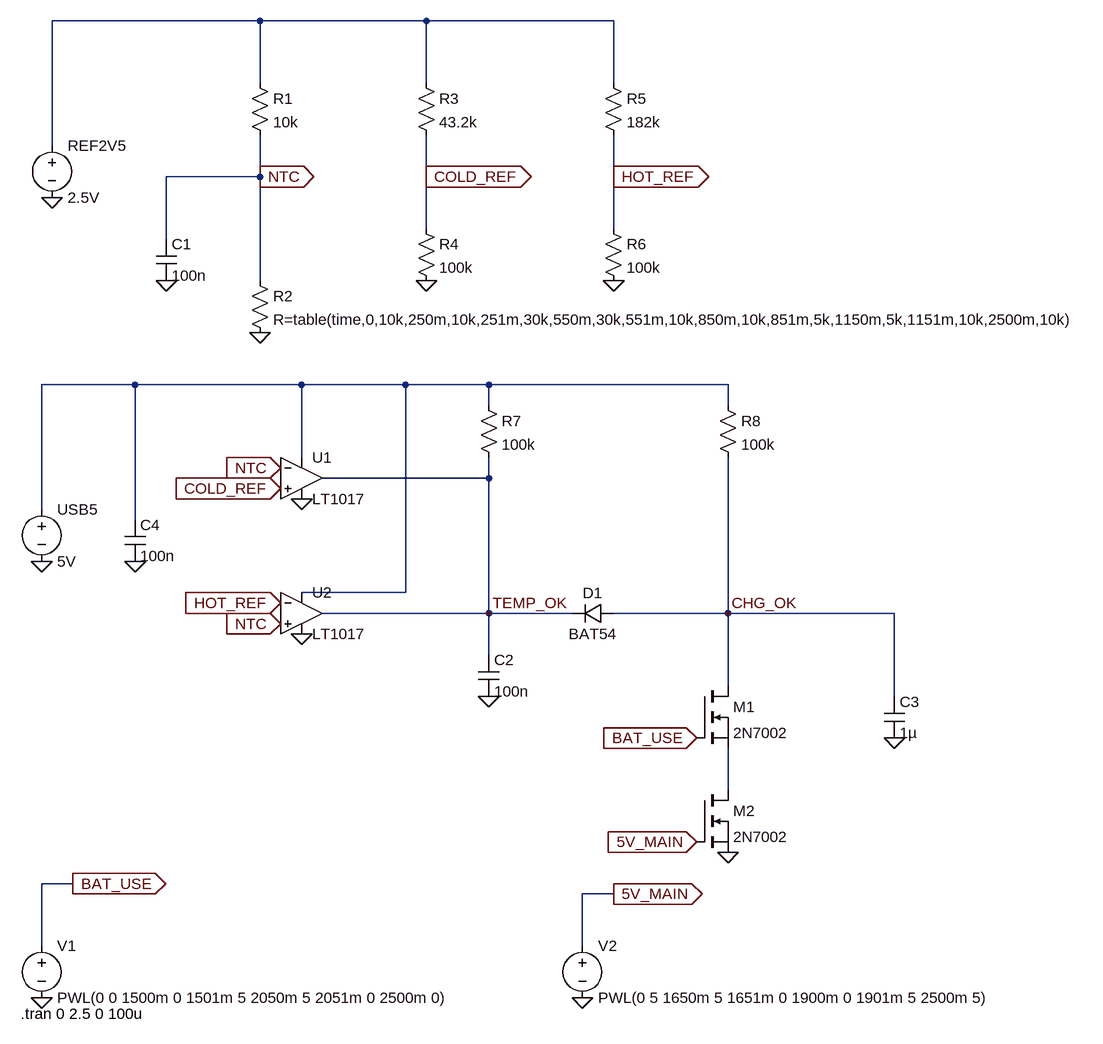
[diagram p0: schematic Temperature Protection.asc]
Temperature Protection.asc, the LTspice schematic file:
Version 4.1
SHEET 1 1864 1144
WIRE 192 -400 -128 -400
WIRE 448 -400 192 -400
WIRE 736 -400 448 -400
WIRE 192 -304 192 -400
WIRE 448 -304 448 -400
WIRE 736 -304 736 -400
WIRE -128 -208 -128 -400
WIRE 192 -160 192 -224
WIRE 192 -160 48 -160
WIRE 448 -160 448 -224
WIRE 736 -160 736 -224
WIRE 448 -80 448 -160
WIRE 736 -80 736 -160
WIRE 48 -64 48 -160
WIRE 192 0 192 -160
WIRE 0 160 -144 160
WIRE 256 160 0 160
WIRE 416 160 256 160
WIRE 544 160 416 160
WIRE 912 160 544 160
WIRE 544 192 544 160
WIRE 912 192 912 160
WIRE 256 272 256 160
WIRE 544 304 544 272
WIRE 544 304 288 304
WIRE -144 352 -144 160
WIRE 0 368 0 160
WIRE 416 480 416 160
WIRE 416 480 256 480
WIRE 544 512 544 304
WIRE 544 512 288 512
WIRE 672 512 544 512
WIRE 912 512 912 272
WIRE 912 512 736 512
WIRE 1168 512 912 512
WIRE 544 576 544 512
WIRE 912 624 912 512
WIRE 1168 640 1168 512
WIRE 912 784 912 720
WIRE -96 928 -144 928
WIRE 736 944 688 944
WIRE -144 1024 -144 928
WIRE 688 1024 688 944
FLAG 192 80 0
FLAG 48 0 0
FLAG -128 -128 0
FLAG 448 0 0
FLAG 736 0 0
FLAG 448 -160 COLD_REF
IOPIN 448 -160 Out
FLAG 736 -160 HOT_REF
IOPIN 736 -160 Out
FLAG 192 -160 NTC
IOPIN 192 -160 Out
FLAG 224 320 COLD_REF
IOPIN 224 320 In
FLAG 224 288 NTC
IOPIN 224 288 In
FLAG 224 528 NTC
IOPIN 224 528 In
FLAG 224 496 HOT_REF
IOPIN 224 496 In
FLAG 256 336 0
FLAG 256 544 0
FLAG -144 432 0
FLAG 544 640 0
FLAG 912 880 0
FLAG 1168 704 0
FLAG 864 704 BAT_USE
IOPIN 864 704 In
FLAG 864 864 5V_MAIN
IOPIN 864 864 In
FLAG -96 928 BAT_USE
IOPIN -96 928 Out
FLAG 736 944 5V_MAIN
IOPIN 736 944 Out
FLAG -144 1104 0
FLAG 688 1104 0
FLAG 0 432 0
FLAG 544 512 TEMP_OK
FLAG 912 512 CHG_OK
SYMBOL res 176 -320 R0
SYMATTR InstName R1
SYMATTR Value 10k
SYMBOL res 176 -16 R0
SYMATTR InstName R2
SYMATTR Value R=table(time,0,10k,250m,10k,251m,30k,550m,30k,551m,10k,850m,10k,851m,5k,1150m,5k,1151m,10k,2500m,10k)
SYMBOL cap 32 -64 R0
SYMATTR InstName C1
SYMATTR Value 100n
SYMBOL voltage -128 -224 R0
WINDOW 123 0 0 Left 0
WINDOW 39 0 0 Left 0
SYMATTR InstName REF2V5
SYMATTR Value 2.5V
SYMBOL res 432 -320 R0
SYMATTR InstName R3
SYMATTR Value 43.2k
SYMBOL res 432 -96 R0
SYMATTR InstName R4
SYMATTR Value 100k
SYMBOL res 720 -320 R0
SYMATTR InstName R5
SYMATTR Value 182k
SYMBOL res 720 -96 R0
SYMATTR InstName R6
SYMATTR Value 100k
SYMBOL voltage -144 336 R0
WINDOW 123 0 0 Left 0
WINDOW 39 0 0 Left 0
SYMATTR InstName USB5
SYMATTR Value 5V
SYMBOL Comparators\\LT1017 256 304 R0
SYMATTR InstName U1
SYMBOL Comparators\\LT1017 256 512 R0
SYMATTR InstName U2
SYMBOL cap 528 576 R0
SYMATTR InstName C2
SYMATTR Value 100n
SYMBOL res 528 176 R0
SYMATTR InstName R7
SYMATTR Value 100k
SYMBOL diode 736 496 R90
WINDOW 0 0 32 VBottom 2
WINDOW 3 32 32 VTop 2
SYMATTR InstName D1
SYMATTR Value BAT54
SYMBOL res 896 176 R0
SYMATTR InstName R8
SYMATTR Value 100k
SYMBOL nmos 864 624 R0
SYMATTR InstName M1
SYMATTR Value 2N7002
SYMBOL nmos 864 784 R0
SYMATTR InstName M2
SYMATTR Value 2N7002
SYMBOL cap 1152 640 R0
SYMATTR InstName C3
SYMATTR Value 1µ
SYMBOL voltage -144 1008 R0
WINDOW 123 0 0 Left 0
WINDOW 39 0 0 Left 0
SYMATTR InstName V1
SYMATTR Value PWL(0 0 1500m 0 1501m 5 2050m 5 2051m 0 2500m 0)
SYMBOL voltage 688 1008 R0
WINDOW 123 0 0 Left 0
WINDOW 39 0 0 Left 0
SYMATTR InstName V2
SYMATTR Value PWL(0 5 1650m 5 1651m 0 1900m 0 1901m 5 2500m 5)
SYMBOL cap -16 368 R0
SYMATTR InstName C4
SYMATTR Value 100n
TEXT -176 1128 Left 2 !.tran 0 2.5 0 100u

The netlist it stands for:
* Temperature Protection.asc
R1 N001 NTC 10k
R2 NTC 0 R=table(time,0,10k,250m,10k,251m,30k,550m,30k,551m,10k,850m,10k,851m,5k,1150m,5k,1151m,10k,2500m,10k)
C1 NTC 0 100n
V§REF2V5 N001 0 2.5V
R3 N001 COLD_REF 43.2k
R4 COLD_REF 0 100k
R5 N001 HOT_REF 182k
R6 HOT_REF 0 100k
V§USB5 N002 0 5V
X§U1 COLD_REF NTC N002 0 TEMP_OK LT1017  ; pins In+ In- V+ V- OUT
X§U2 NTC HOT_REF N002 0 TEMP_OK LT1017  ; pins In+ In- V+ V- OUT
C2 TEMP_OK 0 100n
R7 N002 TEMP_OK 100k
D1 CHG_OK TEMP_OK BAT54
R8 N002 CHG_OK 100k
M1 CHG_OK BAT_USE N003 N003 2N7002
M2 N003 5V_MAIN 0 0 2N7002
C3 CHG_OK 0 1µ
V1 BAT_USE 0 PWL(0 0 1500m 0 1501m 5 2050m 5 2051m 0 2500m 0)
V2 5V_MAIN 0 PWL(0 5 1650m 5 1651m 0 1900m 0 1901m 5 2500m 5)
C4 N002 0 100n
.model D D
.lib standard.dio
.model NMOS NMOS
.model PMOS PMOS
.lib standard.mos
.tran 0 2.5 0 100u
.backanno
.end